# Altium schematic sheet Connector_Sheet.SchDoc
size A4; SheetNumber: 6
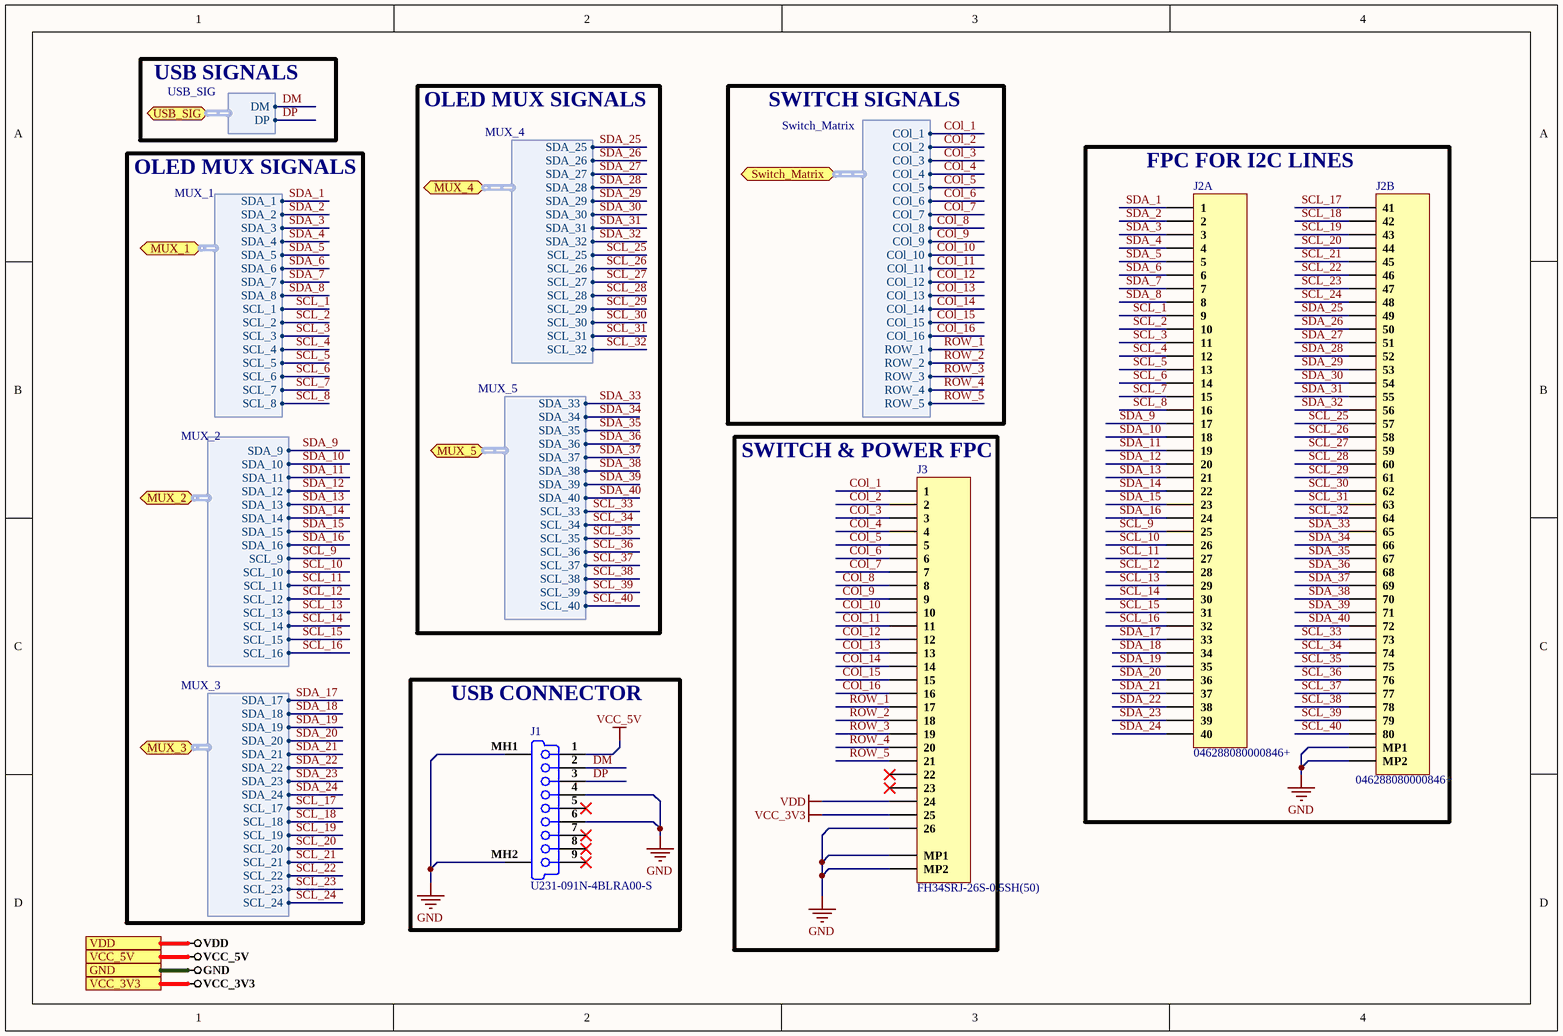
[diagram p0: Connector_Sheet.SchDoc]

## Parts
J1  U231-091N-4BLRA00-S  [U231-091N-4BLRA00-S]
J2  046288080000846+  [046288080000846+]  (parts A,B of 2)
J3  FH34SRJ-26S-0.5SH(50)  [FH34SRJ-26S-0.5SH(50)]

## Blocks framed on the sheet
FPC FOR I2C LINES: J2
SWITCH & POWER FPC: J3
USB CONNECTOR: J1

## Ports
GND, MUX_1 (bidir, harness MUX_1), MUX_2 (bidir, harness MUX_2), MUX_3 (bidir, harness MUX_3), MUX_4 (bidir, harness MUX_4), MUX_5 (bidir, harness MUX_5), Switch_Matrix (bidir, harness Switch_Matrix), USB_SIG (bidir, harness USB_SIG), VCC_3V3, VCC_5V, VDD

## Harnesses
USB_SIG: DM, DP
MUX_1: SDA_1, SDA_2, SDA_3, SDA_4, SDA_5, SDA_6, SDA_7, SDA_8, SCL_1, SCL_2, SCL_3, SCL_4, SCL_5, SCL_6, SCL_7, SCL_8
MUX_2: SDA_9, SDA_10, SDA_11, SDA_12, SDA_13, SDA_14, SDA_15, SDA_16, SCL_9, SCL_10, SCL_11, SCL_12, SCL_13, SCL_14, SCL_15, SCL_16
MUX_3: SDA_17, SDA_18, SDA_19, SDA_20, SDA_21, SDA_22, SDA_23, SDA_24, SCL_17, SCL_18, SCL_19, SCL_20, SCL_21, SCL_22, SCL_23, SCL_24
MUX_4: SDA_25, SDA_26, SDA_27, SDA_28, SDA_29, SDA_30, SDA_31, SDA_32, SCL_25, SCL_26, SCL_27, SCL_28, SCL_29, SCL_30, SCL_31, SCL_32
MUX_5: SDA_33, SDA_34, SDA_35, SDA_36, SDA_37, SDA_38, SDA_39, SDA_40, SCL_33, SCL_34, SCL_35, SCL_36, SCL_37, SCL_38, SCL_39, SCL_40
Switch_Matrix: COl_1, COl_2, COl_3, COl_4, COl_5, COl_6, COl_7, ROW_1, ROW_2, ROW_3, ROW_4, ROW_5, COl_8, COl_9, COl_10, COl_11, COl_12, COl_13, COl_14, COl_15, COl_16

## Nets
GND: J1.4(Gnd) J1.6(StdA_SSRX+) J1.MH1(Tab) J1.MH2(Tab) J2.MP1 J2.MP2 J3.26 J3.MP1 J3.MP2 ; port GND
VCC_3V3: J3.25 ; port VCC_3V3
VCC_5V: J1.1(V_BUS_(5V)) ; port VCC_5V
VDD: J3.24 ; port VDD
COl_1: J3.1 ; port Switch_Matrix.COl_1
COl_2: J3.2 ; port Switch_Matrix.COl_2
COl_3: J3.3 ; port Switch_Matrix.COl_3
COl_4: J3.4 ; port Switch_Matrix.COl_4
COl_5: J3.5 ; port Switch_Matrix.COl_5
COl_6: J3.6 ; port Switch_Matrix.COl_6
COl_7: J3.7 ; port Switch_Matrix.COl_7
COl_8: J3.8 ; port Switch_Matrix.COl_8
COl_9: J3.9 ; port Switch_Matrix.COl_9
COl_10: J3.10 ; port Switch_Matrix.COl_10
COl_11: J3.11 ; port Switch_Matrix.COl_11
COl_12: J3.12 ; port Switch_Matrix.COl_12
COl_13: J3.13 ; port Switch_Matrix.COl_13
COl_14: J3.14 ; port Switch_Matrix.COl_14
COl_15: J3.15 ; port Switch_Matrix.COl_15
COl_16: J3.16 ; port Switch_Matrix.COl_16
DM: J1.2(D-) ; port USB_SIG.DM
DP: J1.3(D+) ; port USB_SIG.DP
ROW_1: J3.17 ; port Switch_Matrix.ROW_1
ROW_2: J3.18 ; port Switch_Matrix.ROW_2
ROW_3: J3.19 ; port Switch_Matrix.ROW_3
ROW_4: J3.20 ; port Switch_Matrix.ROW_4
ROW_5: J3.21 ; port Switch_Matrix.ROW_5
SCL_1: J2.9 ; port MUX_1.SCL_1
SCL_2: J2.10 ; port MUX_1.SCL_2
SCL_3: J2.11 ; port MUX_1.SCL_3
SCL_4: J2.12 ; port MUX_1.SCL_4
SCL_5: J2.13 ; port MUX_1.SCL_5
SCL_6: J2.14 ; port MUX_1.SCL_6
SCL_7: J2.15 ; port MUX_1.SCL_7
SCL_8: J2.16 ; port MUX_1.SCL_8
SCL_9: J2.25 ; port MUX_2.SCL_9
SCL_10: J2.26 ; port MUX_2.SCL_10
SCL_11: J2.27 ; port MUX_2.SCL_11
SCL_12: J2.28 ; port MUX_2.SCL_12
SCL_13: J2.29 ; port MUX_2.SCL_13
SCL_14: J2.30 ; port MUX_2.SCL_14
SCL_15: J2.31 ; port MUX_2.SCL_15
SCL_16: J2.32 ; port MUX_2.SCL_16
SCL_17: J2.41 ; port MUX_3.SCL_17
SCL_18: J2.42 ; port MUX_3.SCL_18
SCL_19: J2.43 ; port MUX_3.SCL_19
SCL_20: J2.44 ; port MUX_3.SCL_20
SCL_21: J2.45 ; port MUX_3.SCL_21
SCL_22: J2.46 ; port MUX_3.SCL_22
SCL_23: J2.47 ; port MUX_3.SCL_23
SCL_24: J2.48 ; port MUX_3.SCL_24
SCL_25: J2.57 ; port MUX_4.SCL_25
SCL_26: J2.58 ; port MUX_4.SCL_26
SCL_27: J2.59 ; port MUX_4.SCL_27
SCL_28: J2.60 ; port MUX_4.SCL_28
SCL_29: J2.61 ; port MUX_4.SCL_29
SCL_30: J2.62 ; port MUX_4.SCL_30
SCL_31: J2.63 ; port MUX_4.SCL_31
SCL_32: J2.64 ; port MUX_4.SCL_32
SCL_33: J2.73 ; port MUX_5.SCL_33
SCL_34: J2.74 ; port MUX_5.SCL_34
SCL_35: J2.75 ; port MUX_5.SCL_35
SCL_36: J2.76 ; port MUX_5.SCL_36
SCL_37: J2.77 ; port MUX_5.SCL_37
SCL_38: J2.78 ; port MUX_5.SCL_38
SCL_39: J2.79 ; port MUX_5.SCL_39
SCL_40: J2.80 ; port MUX_5.SCL_40
SDA_1: J2.1 ; port MUX_1.SDA_1
SDA_2: J2.2 ; port MUX_1.SDA_2
SDA_3: J2.3 ; port MUX_1.SDA_3
SDA_4: J2.4 ; port MUX_1.SDA_4
SDA_5: J2.5 ; port MUX_1.SDA_5
SDA_6: J2.6 ; port MUX_1.SDA_6
SDA_7: J2.7 ; port MUX_1.SDA_7
SDA_8: J2.8 ; port MUX_1.SDA_8
SDA_9: J2.17 ; port MUX_2.SDA_9
SDA_10: J2.18 ; port MUX_2.SDA_10
SDA_11: J2.19 ; port MUX_2.SDA_11
SDA_12: J2.20 ; port MUX_2.SDA_12
SDA_13: J2.21 ; port MUX_2.SDA_13
SDA_14: J2.22 ; port MUX_2.SDA_14
SDA_15: J2.23 ; port MUX_2.SDA_15
SDA_16: J2.24 ; port MUX_2.SDA_16
SDA_17: J2.33 ; port MUX_3.SDA_17
SDA_18: J2.34 ; port MUX_3.SDA_18
SDA_19: J2.35 ; port MUX_3.SDA_19
SDA_20: J2.36 ; port MUX_3.SDA_20
SDA_21: J2.37 ; port MUX_3.SDA_21
SDA_22: J2.38 ; port MUX_3.SDA_22
SDA_23: J2.39 ; port MUX_3.SDA_23
SDA_24: J2.40 ; port MUX_3.SDA_24
SDA_25: J2.49 ; port MUX_4.SDA_25
SDA_26: J2.50 ; port MUX_4.SDA_26
SDA_27: J2.51 ; port MUX_4.SDA_27
SDA_28: J2.52 ; port MUX_4.SDA_28
SDA_29: J2.53 ; port MUX_4.SDA_29
SDA_30: J2.54 ; port MUX_4.SDA_30
SDA_31: J2.55 ; port MUX_4.SDA_31
SDA_32: J2.56 ; port MUX_4.SDA_32
SDA_33: J2.65 ; port MUX_5.SDA_33
SDA_34: J2.66 ; port MUX_5.SDA_34
SDA_35: J2.67 ; port MUX_5.SDA_35
SDA_36: J2.68 ; port MUX_5.SDA_36
SDA_37: J2.69 ; port MUX_5.SDA_37
SDA_38: J2.70 ; port MUX_5.SDA_38
SDA_39: J2.71 ; port MUX_5.SDA_39
SDA_40: J2.72 ; port MUX_5.SDA_40

Not connected (* = marked no-connect by the designer): J1 5(StdA_SSRX-)* 7(GND_DRAIN)* 8(StdA_SSTX-)* 9(StdA_SSTX+)*; J3 22* 23*

## Notes on the sheet
- USB SIGNALS
- OLED MUX SIGNALS
- SWITCH SIGNALS

## Library data of the parts
J1 = U231-091N-4BLRA00-S: USB 3.0 1 9 Male Type-A SMD USB Connectors ROHS; Manufacturer: XKB Connectivity; Number of Ports: 1; Standard: USB 3.0; Mounting Style: Surface Mount
J2 = 046288080000846+: 0.5MM PITCH - 80 POS - RIGHT ANG; Manufacturer: Kyocera AVX; Manufacturer Part No: 046288080000846+; Package: Custom; ComponentLink1Description: LCSC; ComponentLink1URL: https://lcsc.com/product-detail/FFC-span-style-background-color-ff0-FPC-span-Connectors_Kyocera-046288080000846_C513346.html
J3 = FH34SRJ-26S-0.5SH(50): CONN FFC FPC 26POS 0.50MM R/A; Manufacturer: Hirose; Manufacturer Part Number: FH34SRJ-8S-0.5SH(99); Supplier 1: RSComponents; RoHS: Yes; Category: FFC / FPC; Stock 1: 190; Pricing 1: 5=2.79500, 25=2.28400, 100=2.17100, 250=1.96400 (USD); ComponentLink1URL: https://datasheet.ciiva.com/18561/ed-fh34s-20140305-18561974.pdf?src-supplier=Digi-Key; ComponentLink1Description: https://datasheet.ciiva.com/18561/ed-fh34s-20140305-18561974.pdf?src-supplier=Digi-Key; Supplier Part Number 1: 1362475